# Altium schematic sheet Connector_Sheet.SchDoc
size A4; SheetNumber: 6; SheetTotal: 6
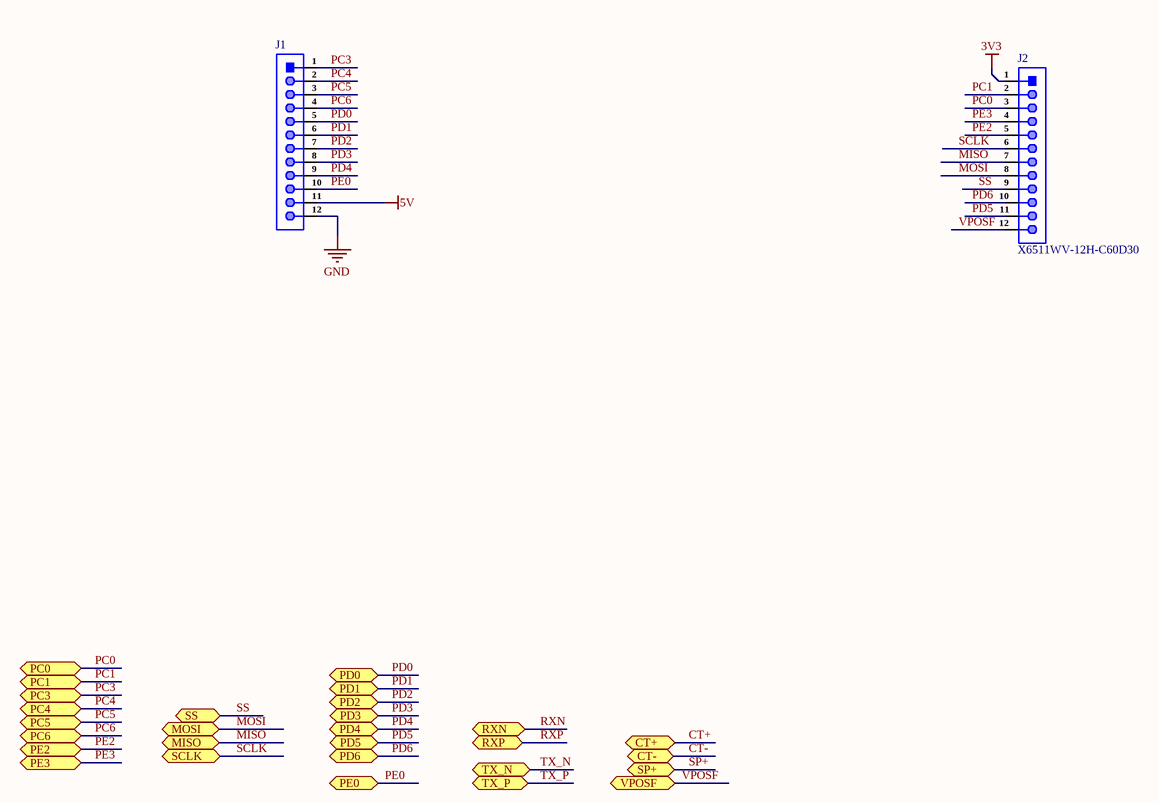
[diagram p0: Connector_Sheet.SchDoc]

## Parts
J1  X6511WV-12H-C60D30  [HDR 1x12 TH]  (value not drawn)
J2  X6511WV-12H-C60D30  [HDR 1x12 TH]

## Ports
CT+ (bidir, see POE_Sheet[4A]), CT- (bidir, see POE_Sheet[4A]), MISO (bidir, see Controller_Sheet[4B], Ethernet_Sheet[1D]), MOSI (bidir, see Controller_Sheet[4B], Ethernet_Sheet[1D]), PC0 (bidir, see Controller_Sheet[4B]), PC1 (bidir, see Controller_Sheet[4B]), PC3 (bidir, see Controller_Sheet[4B]), PC4 (bidir, see Controller_Sheet[4B]), PC5 (bidir, see Controller_Sheet[4B]), PC6 (bidir, see Controller_Sheet[4B]), PD0 (bidir, see Controller_Sheet[4C]), PD1 (bidir, see Controller_Sheet[4C]), PD2 (bidir, see Controller_Sheet[4C]), PD3 (bidir, see Controller_Sheet[4C]), PD4 (bidir, see Controller_Sheet[4C]), PD5 (bidir, see Controller_Sheet[4C]), PD6 (bidir, see Controller_Sheet[4C]), PE0 (bidir, see Controller_Sheet[4C]), PE2 (bidir, see Controller_Sheet[4B]), PE3 (bidir, see Controller_Sheet[4B]), RXN (bidir, see Ethernet_Sheet[1C]), RXP (bidir, see Ethernet_Sheet[1C]), SCLK (bidir, see Controller_Sheet[4B], Ethernet_Sheet[1D]), SP+ (bidir, see POE_Sheet[4A]), SS (bidir, see Controller_Sheet[4B]), TX_N (bidir, see Ethernet_Sheet[1C]), TX_P (bidir, see Ethernet_Sheet[1C]), VPOSF (bidir, see POE_Sheet[4A])

## Nets
3V3: J2.1
5V: J1.11
GND: J1.12
CT+: port CT+
CT-: port CT-
MISO: J2.7 ; port MISO
MOSI: J2.8 ; port MOSI
PC0: J2.3 ; port PC0
PC1: J2.2 ; port PC1
PC3: J1.1 ; port PC3
PC4: J1.2 ; port PC4
PC5: J1.3 ; port PC5
PC6: J1.4 ; port PC6
PD0: J1.5 ; port PD0
PD1: J1.6 ; port PD1
PD2: J1.7 ; port PD2
PD3: J1.8 ; port PD3
PD4: J1.9 ; port PD4
PD5: J2.11 ; port PD5
PD6: J2.10 ; port PD6
PE0: J1.10 ; port PE0
PE2: J2.5 ; port PE2
PE3: J2.4 ; port PE3
RXN: port RXN
RXP: port RXP
SCLK: J2.6 ; port SCLK
SP+: port SP+
SS: J2.9 ; port SS
TX_N: port TX_N
TX_P: port TX_P
VPOSF: J2.12 ; port VPOSF

## Notes on the sheet
- File:
- Title:
- Date:
- Page
- Num:
- Total:
- Drawn By: Huzaifa Ali

## Library data of the parts
J1 J2 = X6511WV-12H-C60D30: Gold 250V 3A Square Pins 2.5mm 12P 260℃ 6mm -40℃~+105℃ 3mm 2.54mm Plugin Black Brass 2.54mm 1x12P Plugin,P=2.54mm Pin Headers ROHS; Manufacturer: XKB; Item Type: Male Header; Manufacturer Part Number: X6511WV-12H-C60D30; Package: Plugin,P=2.54mm; LCSC Part Number: C725944; ComponentLink1Description: LCSC; ComponentLink1URL: https://www.lcsc.com/product-detail/Pin-Headers_XKB-Connection-X6511WV-12H-C60D30_C725944.html